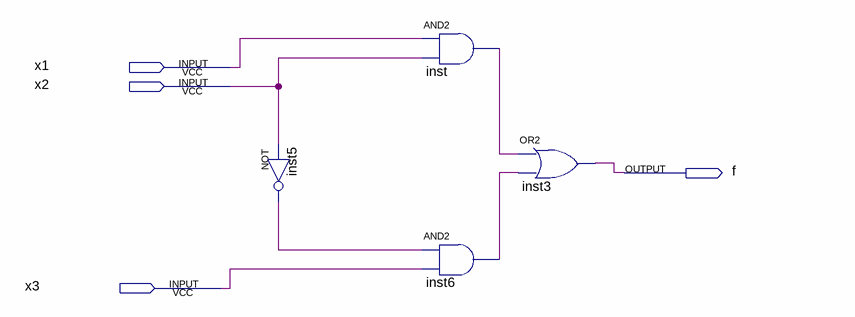
[diagram p0: schematic sheet]
// Quartus schematic COE328_LAB1.bdf as structural Verilog: 4 symbols, 4 pins
module COE328_LAB1 (
  input  x1,
  input  x2,
  input  x3,
  output f
);

  wire inst5_out, inst6_out, inst_out;

  not inst5 (inst5_out, x2);
  and inst (inst_out, x1, x2);
  and inst6 (inst6_out, inst5_out, x3);
  or inst3 (f, inst_out, inst6_out);
endmodule
